# Altium schematic sheet Mcu.SchDoc
size A4; SheetNumber: 2; SheetTotal: 2
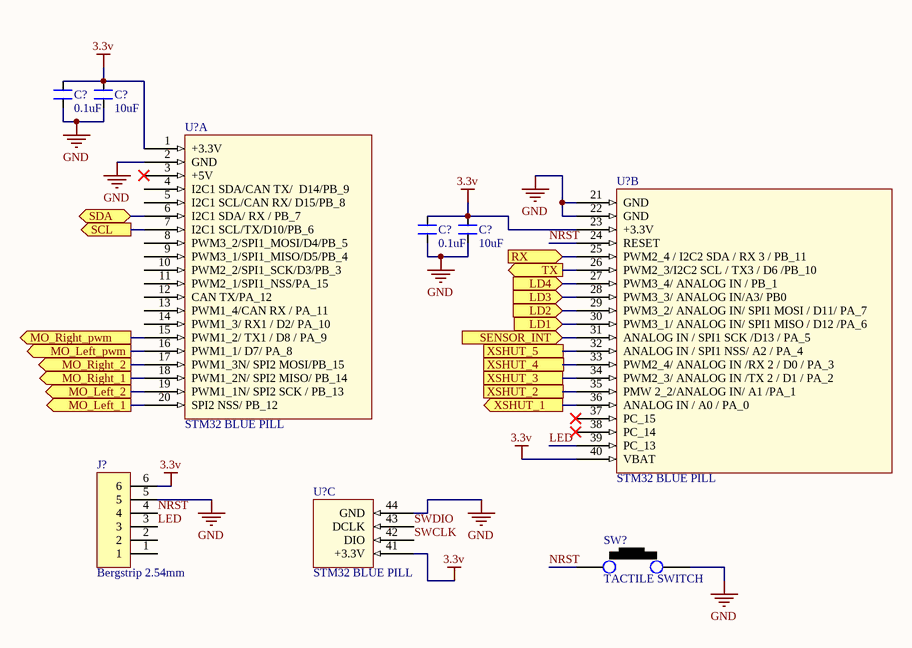
[diagram p0: Mcu.SchDoc]

## Parts
(Parts that share a designator on the sheet are numbered #1, #2 ... from top to bottom, then left to right.)
C?#1  0.1uF  [CAP_0805]
C?#2  10uF  [CAP_1206]
C?#3  0.1uF  [CAP_0805]
C?#4  10uF  [CAP_1206]
J?  Bergstrip 2.54mm  [CON6_100_59D78_TH_ST]
SW?  TACTILE SWITCH  [SW_342_SMD]
U?#1  STM32 BLUE PILL  [MOD_STM-BLUE-PILL]  (part A of 3)
U?#2  STM32 BLUE PILL  [MOD_STM-BLUE-PILL]  (part B of 3)
U?#3  STM32 BLUE PILL  [MOD_STM-BLUE-PILL]  (part C of 3)

## Ports
LD1 (in, see Schematic[2B]), LD2 (in, see Schematic[3B]), LD3 (in, see Schematic[2B]), LD4 (in, see Schematic[3B]), MO_Left_1 (out, see Schematic[4A]), MO_Left_2 (out, see Schematic[4A]), MO_Left_pwm (out, see Schematic[4A], Schematic[4B]), MO_Right_1 (out, see Schematic[4C]), MO_Right_2 (out, see Schematic[4C]), MO_Right_pwm (out, see Schematic[4B], Schematic[4C]), RX (in), SCL (out, see Schematic[1C], Schematic[1D], Schematic[2A], Schematic[3A]), SDA (bidir, see Schematic[1C], Schematic[1D], Schematic[2A], Schematic[3A]), SENSOR_INT (in, see Schematic[2A]), TX (out), XSHUT_1 (out, see Schematic[2A]), XSHUT_2 (out, see Schematic[2A]), XSHUT_3 (out, see Schematic[3A]), XSHUT_4 (out, see Schematic[2A]), XSHUT_5 (out, see Schematic[2A])

## Nets
3.3v: C?#1.2 C?#2.2 C?#3.2 C?#4.2 J?.6 U?#1.1(+3.3V) U?#2.23(+3.3V) U?#2.40(VBAT) U?#3.41(+3.3V)
GND: C?#1.1 C?#2.1 C?#3.1 C?#4.1 J?.5 SW?.2 U?#1.2(GND) U?#2.21(GND) U?#2.22(GND) U?#3.44(GND)
LD1: U?#2.30(PWM3_1/_ANALOG_IN/_SPI1_MISO_/_D12_/PA_6) ; port LD1
LD2: U?#2.29(PWM3_2/_ANALOG_IN/_SPI1_MOSI_/_D11/_PA_7) ; port LD2
LD3: U?#2.28(PWM3_3/_ANALOG_IN/A3/_PB0) ; port LD3
LD4: U?#2.27(PWM3_4/_ANALOG_IN_/_PB_1) ; port LD4
LED: J?.3 U?#2.39(PC_13)
MO_Left_1: U?#1.20(SPI2_NSS/_PB_12) ; port MO_Left_1
MO_Left_2: U?#1.19(PWM1_1N/_SPI2_SCK_/_PB_13) ; port MO_Left_2
MO_Left_pwm: U?#1.16(PWM1_1/_D7/_PA_8) ; port MO_Left_pwm
MO_Right_1: U?#1.18(PWM1_2N/_SPI2_MISO/_PB_14) ; port MO_Right_1
MO_Right_2: U?#1.17(PWM1_3N/_SPI2_MOSI/PB_15) ; port MO_Right_2
MO_Right_pwm: U?#1.15(PWM1_2/_TX1_/_D8_/_PA_9) ; port MO_Right_pwm
NRST: J?.4 SW?.1 U?#2.24(RESET)
RX: U?#2.25(PWM2_4_/_I2C2_SDA_/_RX_3_/_PB_11) ; port RX
SCL: U?#1.7(I2C1_SCL/TX/D10/PB_6) ; port SCL
SDA: U?#1.6(I2C1_SDA/_RX_/_PB_7) ; port SDA
SENSOR_INT: U?#2.31(ANALOG_IN_/_SPI1_SCK_/D13_/_PA_5) ; port SENSOR_INT
SWCLK: U?#3.42(DIO)
SWDIO: U?#3.43(DCLK)
TX: U?#2.26(PWM2_3/I2C2_SCL_/_TX3_/_D6_/PB_10) ; port TX
XSHUT_1: U?#2.36(ANALOG_IN_/_A0_/_PA_0) ; port XSHUT_1
XSHUT_2: U?#2.35(PMW_2_2/ANALOG_IN/_A1_/PA_1) ; port XSHUT_2
XSHUT_3: U?#2.34(PWM2_3/_ANALOG_IN_/TX_2_/_D1_/_PA_2) ; port XSHUT_3
XSHUT_4: U?#2.33(PWM2_4/_ANALOG_IN_/RX_2_/_D0_/_PA_3) ; port XSHUT_4
XSHUT_5: U?#2.32(ANALOG_IN_/_SPI1_NSS/_A2_/_PA_4) ; port XSHUT_5

Not connected (* = marked no-connect by the designer): J? 1 2; U?#1 3(+5V)* 4(I2C1_SDA/CAN_TX/__D14/PB_9) 5(I2C1_SCL/CAN_RX/_D15/PB_8) 8(PWM3_2/SPI1_MOSI/D4/PB_5) 9(PWM3_1/SPI1_MISO/D5/PB_4) 10(PWM2_2/SPI1_SCK/D3/PB_3) 11(PWM2_1/SPI1_NSS/PA_15) 12(CAN_TX/PA_12) 13(PWM1_4/CAN_RX_/_PA_11) 14(PWM1_3/_RX1_/_D2/_PA_10); U?#2 37(PC_15)* 38(PC_14)*

## Library data of the parts
C?#1 C?#3 = CAP_0.1uF-50V-5%-0805: 0.1µF ±5% 50V Ceramic Capacitor X7R 0805 (2012 Metric); Manufacturer: AVX Corporation; Manufacturer Part Number: 08055C104JAT4A; Alternate Part Number-1: 0805B104M500; Case/Package: 0805; Supplier-1: SIRICOM; Supplier Part Number-1: 0805B104J500CT
C?#2 C?#4 = CAP_10uF-50V-10%-1206: 10µF ±10% 50V Ceramic Capacitor X7R 1206 (3216 Metric); Manufacturer: KEMET; Manufacturer Part Number: CL31B106KBHNNNE; Alternate Part Number-1: GRT31CR61H106ME01L; Case/Package: 1206; Supplier-1: SIRICOM; Supplier Part Number-1: CC1206KKX5R9BB106
J? = CON-BS-SKT_6X1-100-ST-TH: 6 Pins, 1 Row 2.54mm Pitch, Straight bergstrip, Female; Manufacturer: Molex; Alternate Part Number-1: NA; Manufacturer Part Number: 22-10-2061; Case/Package: TH-CON; Supplier-1: SP ROAD; Supplier Part Number-1: NA
SW? = SW1_RS-282G05A3-SMRT-SMD: Tactile Switch SPST-NO Top Actuated Surface Mount; Manufacturer: ITT C&K; Alternate Part Number-1: NA; Manufacturer Part Number: RS-282G05A3-SMRT; Case/Package: SMD; Supplier-1: SP ROAD; Supplier Part Number-1: RS-282G05A3-SMRT
U?#1-U?#3 = MOD-STM32-BLUE PILL: Manufacturer Part Number: NA; Case/Package: TH; Manufacturer: NA; Supplier-1: SP ROAD; Supplier Part Number-1: NA; Alternate Part Number-1: NA